# Altium schematic sheet 02_SoC_DRAM_DDR4.SchDoc
size A3; SheetNumber: 15; SheetTotal: 21
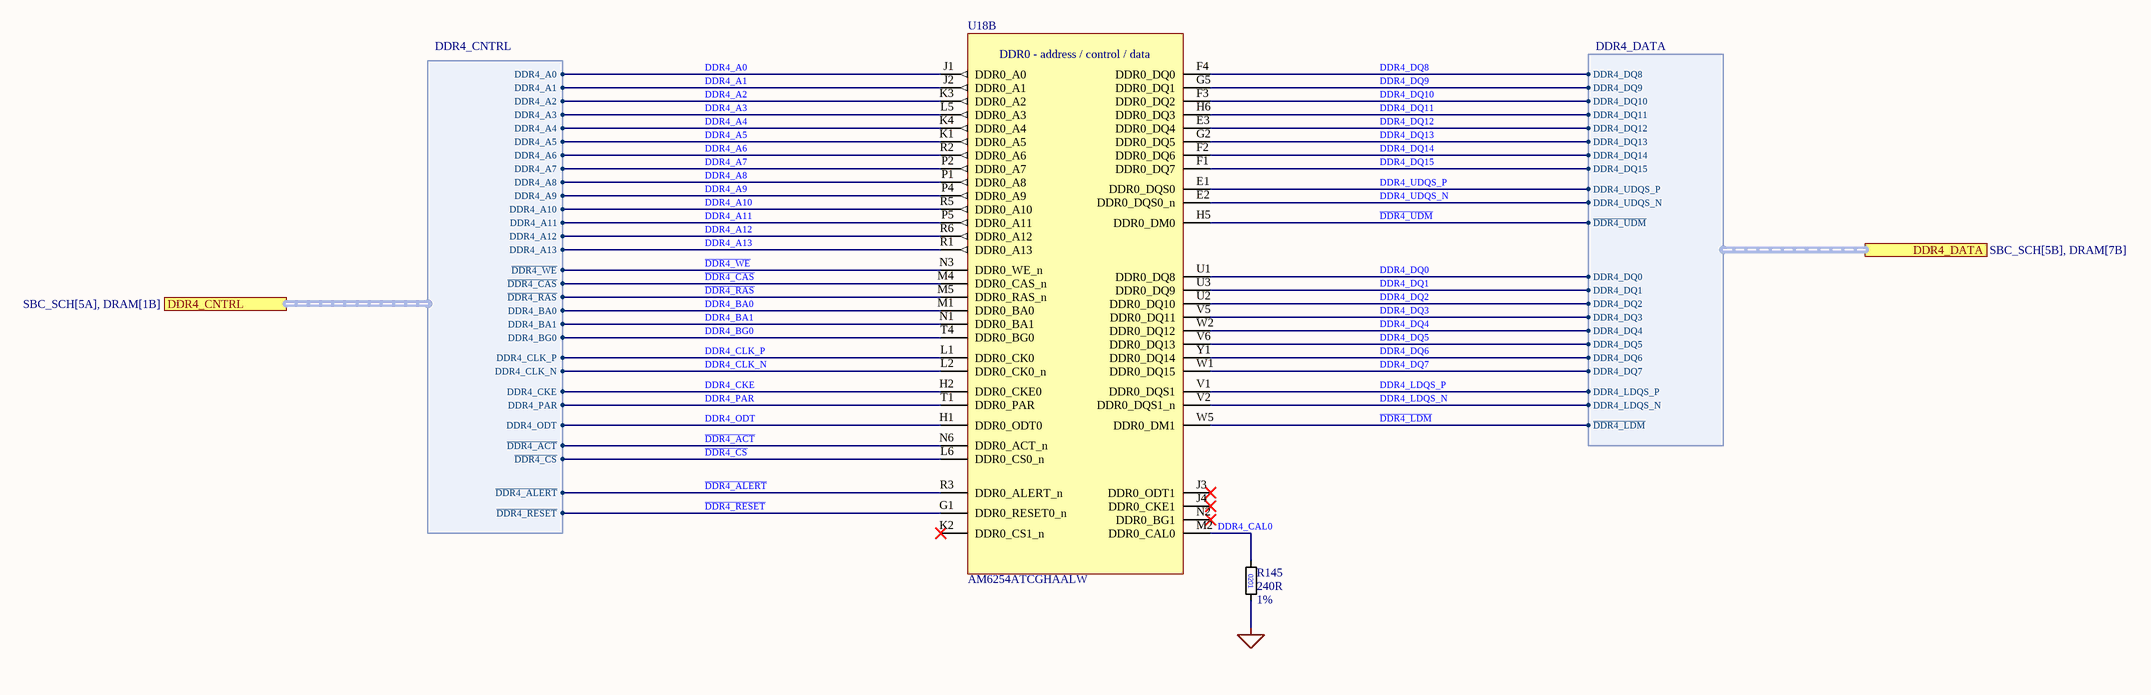
[diagram p0: 02_SoC_DRAM_DDR4.SchDoc]

## Parts
R145  value 240R  Tolerance: 1%  [R0201]  (hidden comment: 0201)
U18  AM6254ATCGHAALW  [AM6254ATCGHAALW]  (part B of 15)

## Ports
DDR4_CNTRL (harness DDR4_CNTRL, see SBC_SCH[5A], DRAM[1B]), DDR4_DATA (harness DDR4_DATA, see SBC_SCH[5B], DRAM[7B])

## Harnesses
DDR4_CNTRL: DDR4_A0, DDR4_A1, DDR4_A2, DDR4_A3, DDR4_A4, DDR4_A5, DDR4_A6, DDR4_A7, DDR4_A8, DDR4_A9, DDR4_A10, DDR4_A11, DDR4_A12, DDR4_A13, ~{DDR4_WE}, ~{DDR4_CAS}, ~{DDR4_RAS}, DDR4_BA0, DDR4_BA1, DDR4_BG0, DDR4_CLK_P, DDR4_CLK_N, DDR4_CKE, DDR4_PAR, DDR4_ODT, ~{DDR4_ACT}, ~{DDR4_CS}, ~{DDR4_ALERT}, ~{DDR4_RESET}
DDR4_DATA: DDR4_DQ8, DDR4_DQ9, DDR4_DQ10, DDR4_DQ11, DDR4_DQ12, DDR4_DQ13, DDR4_DQ14, DDR4_DQ15, DDR4_UDQS_P, DDR4_UDQS_N, ~{DDR4_UDM}, DDR4_DQ0, DDR4_DQ1, DDR4_DQ2, DDR4_DQ3, DDR4_DQ4, DDR4_DQ5, DDR4_DQ6, DDR4_DQ7, DDR4_LDQS_P, DDR4_LDQS_N, ~{DDR4_LDM}

## Nets
GND: R145.2
~{DDR4_ACT}: U18.N6(DDR0_ACT_n) ; port DDR4_CNTRL.~{DDR4_ACT}
~{DDR4_ALERT}: U18.R3(DDR0_ALERT_n) ; port DDR4_CNTRL.~{DDR4_ALERT}
~{DDR4_CAS}: U18.M4(DDR0_CAS_n) ; port DDR4_CNTRL.~{DDR4_CAS}
~{DDR4_CS}: U18.L6(DDR0_CS0_n) ; port DDR4_CNTRL.~{DDR4_CS}
~{DDR4_LDM}: U18.W5(DDR0_DM1) ; port DDR4_DATA.~{DDR4_LDM}
~{DDR4_RAS}: U18.M5(DDR0_RAS_n) ; port DDR4_CNTRL.~{DDR4_RAS}
~{DDR4_RESET}: U18.G1(DDR0_RESET0_n) ; port DDR4_CNTRL.~{DDR4_RESET}
~{DDR4_UDM}: U18.H5(DDR0_DM0) ; port DDR4_DATA.~{DDR4_UDM}
~{DDR4_WE}: U18.N3(DDR0_WE_n) ; port DDR4_CNTRL.~{DDR4_WE}
DDR4_A0: U18.J1(DDR0_A0) ; port DDR4_CNTRL.DDR4_A0
DDR4_A1: U18.J2(DDR0_A1) ; port DDR4_CNTRL.DDR4_A1
DDR4_A2: U18.K3(DDR0_A2) ; port DDR4_CNTRL.DDR4_A2
DDR4_A3: U18.L5(DDR0_A3) ; port DDR4_CNTRL.DDR4_A3
DDR4_A4: U18.K4(DDR0_A4) ; port DDR4_CNTRL.DDR4_A4
DDR4_A5: U18.K1(DDR0_A5) ; port DDR4_CNTRL.DDR4_A5
DDR4_A6: U18.R2(DDR0_A6) ; port DDR4_CNTRL.DDR4_A6
DDR4_A7: U18.P2(DDR0_A7) ; port DDR4_CNTRL.DDR4_A7
DDR4_A8: U18.P1(DDR0_A8) ; port DDR4_CNTRL.DDR4_A8
DDR4_A9: U18.P4(DDR0_A9) ; port DDR4_CNTRL.DDR4_A9
DDR4_A10: U18.R5(DDR0_A10) ; port DDR4_CNTRL.DDR4_A10
DDR4_A11: U18.P5(DDR0_A11) ; port DDR4_CNTRL.DDR4_A11
DDR4_A12: U18.R6(DDR0_A12) ; port DDR4_CNTRL.DDR4_A12
DDR4_A13: U18.R1(DDR0_A13) ; port DDR4_CNTRL.DDR4_A13
DDR4_BA0: U18.M1(DDR0_BA0) ; port DDR4_CNTRL.DDR4_BA0
DDR4_BA1: U18.N1(DDR0_BA1) ; port DDR4_CNTRL.DDR4_BA1
DDR4_BG0: U18.T4(DDR0_BG0) ; port DDR4_CNTRL.DDR4_BG0
DDR4_CAL0: R145.1 U18.M2(DDR0_CAL0)
DDR4_CKE: U18.H2(DDR0_CKE0) ; port DDR4_CNTRL.DDR4_CKE
DDR4_CLK_N: U18.L2(DDR0_CK0_n) ; port DDR4_CNTRL.DDR4_CLK_N
DDR4_CLK_P: U18.L1(DDR0_CK0) ; port DDR4_CNTRL.DDR4_CLK_P
DDR4_DQ0: U18.U1(DDR0_DQ8) ; port DDR4_DATA.DDR4_DQ0
DDR4_DQ1: U18.U3(DDR0_DQ9) ; port DDR4_DATA.DDR4_DQ1
DDR4_DQ2: U18.U2(DDR0_DQ10) ; port DDR4_DATA.DDR4_DQ2
DDR4_DQ3: U18.V5(DDR0_DQ11) ; port DDR4_DATA.DDR4_DQ3
DDR4_DQ4: U18.W2(DDR0_DQ12) ; port DDR4_DATA.DDR4_DQ4
DDR4_DQ5: U18.V6(DDR0_DQ13) ; port DDR4_DATA.DDR4_DQ5
DDR4_DQ6: U18.Y1(DDR0_DQ14) ; port DDR4_DATA.DDR4_DQ6
DDR4_DQ7: U18.W1(DDR0_DQ15) ; port DDR4_DATA.DDR4_DQ7
DDR4_DQ8: U18.F4(DDR0_DQ0) ; port DDR4_DATA.DDR4_DQ8
DDR4_DQ9: U18.G5(DDR0_DQ1) ; port DDR4_DATA.DDR4_DQ9
DDR4_DQ10: U18.F3(DDR0_DQ2) ; port DDR4_DATA.DDR4_DQ10
DDR4_DQ11: U18.H6(DDR0_DQ3) ; port DDR4_DATA.DDR4_DQ11
DDR4_DQ12: U18.E3(DDR0_DQ4) ; port DDR4_DATA.DDR4_DQ12
DDR4_DQ13: U18.G2(DDR0_DQ5) ; port DDR4_DATA.DDR4_DQ13
DDR4_DQ14: U18.F2(DDR0_DQ6) ; port DDR4_DATA.DDR4_DQ14
DDR4_DQ15: U18.F1(DDR0_DQ7) ; port DDR4_DATA.DDR4_DQ15
DDR4_LDQS_N: U18.V2(DDR0_DQS1_n) ; port DDR4_DATA.DDR4_LDQS_N
DDR4_LDQS_P: U18.V1(DDR0_DQS1) ; port DDR4_DATA.DDR4_LDQS_P
DDR4_ODT: U18.H1(DDR0_ODT0) ; port DDR4_CNTRL.DDR4_ODT
DDR4_PAR: U18.T1(DDR0_PAR) ; port DDR4_CNTRL.DDR4_PAR
DDR4_UDQS_N: U18.E2(DDR0_DQS0_n) ; port DDR4_DATA.DDR4_UDQS_N
DDR4_UDQS_P: U18.E1(DDR0_DQS0) ; port DDR4_DATA.DDR4_UDQS_P

Not connected (* = marked no-connect by the designer): U18 J3(DDR0_ODT1)* J4(DDR0_CKE1)* K2(DDR0_CS1_n)* N2(DDR0_BG1)*

## Notes on the sheet
- (in symbol AM6254ATCGHAALW, part B) DDR0 - address / control / data

## Library data of the parts
R145 = R_0201: Manufacturer_Name: *; Manufacturer_Part_Number: *
U18 = AM6254ATCGHAALW: TI AM6254, quad Cortex-A53 SoC, ALW 425-ball FCCSP 13x13mm 0.5mm pitch; separate interface and power units; Pinmux_Note: Each physical ball occurs once under its primary interface. See companion pinmux CSV for alternate functions. Multiplexable digital pads use bidirectional ERC type.; KiCad_Footprint: SamacSys_Parts:BGA425C50P25X25_1300X1300X89; MPN: AM6254ATCGHAALW; Footprint_Note: Unassigned: requires verified ALW0425 425-ball FCCSP, 13x13mm, 0.5mm pitch; do not substitute a fully populated BGA.; Datasheet: https://www.ti.com/lit/ds/symlink/am625.pdf; ComponentLink1Description: Datasheet; ComponentLink1URL: https://www.ti.com/lit/ds/symlink/am625.pdf